# Altium schematic sheet 50_Audio_Codec.SchDoc: Audio
size A4; DrawnBy: Mateo Cárdenas; Revision: Rev A; SheetNumber: 6; SheetTotal: 7
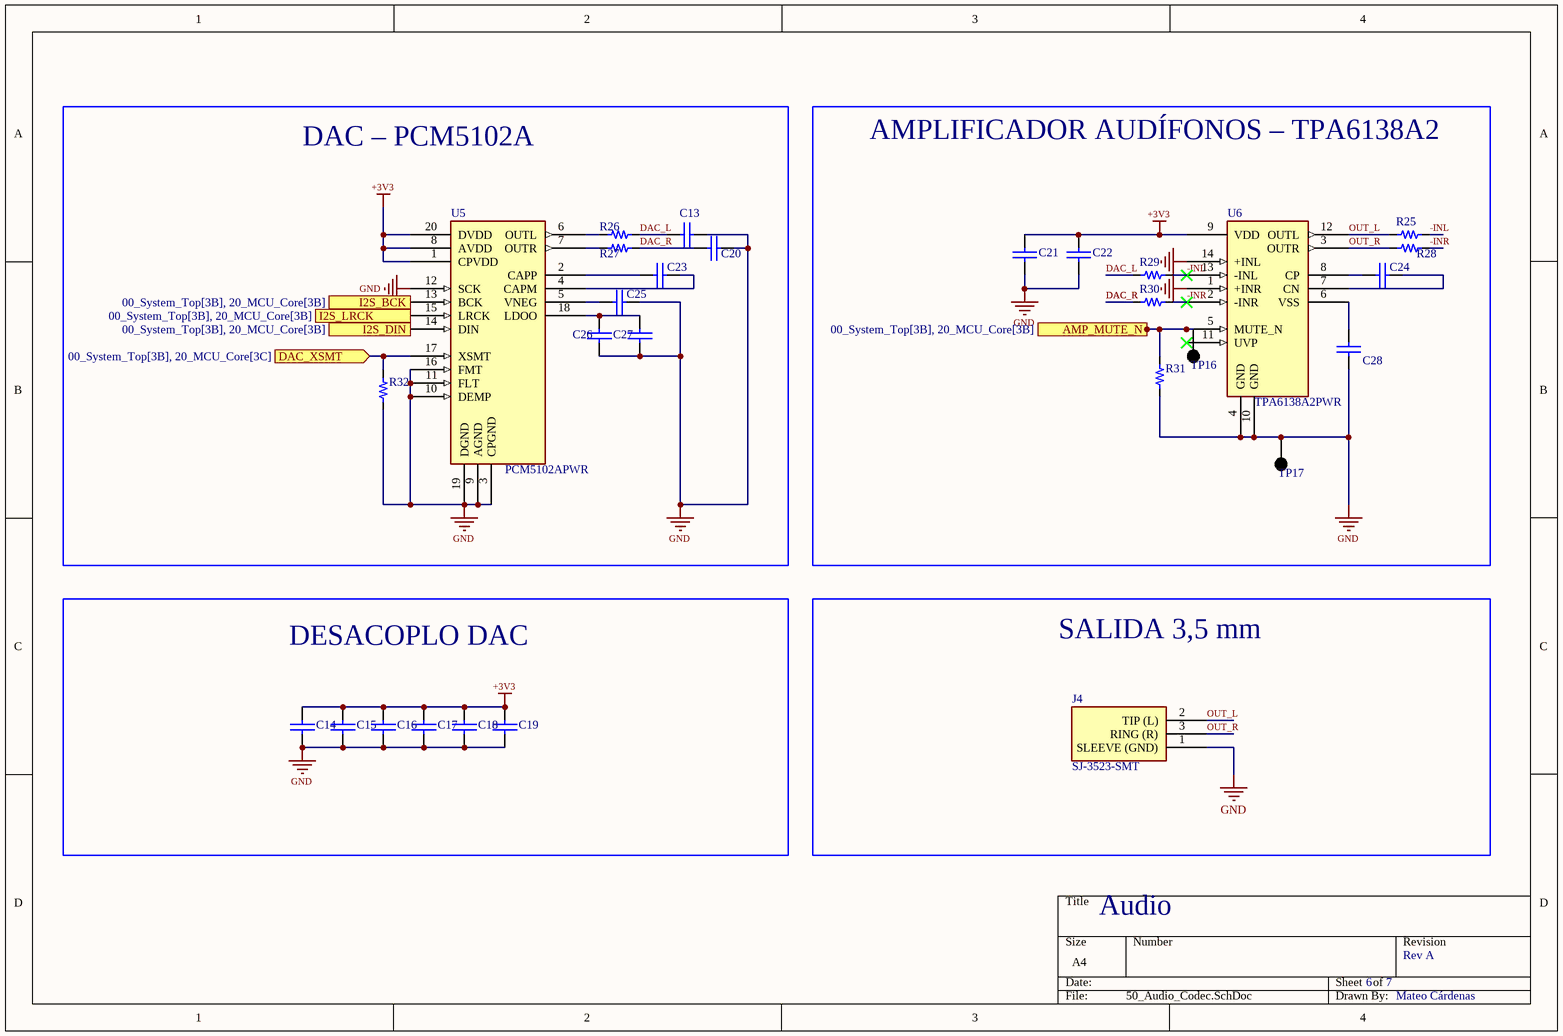
[diagram p0: 50_Audio_Codec.SchDoc]

## Parts
C13  2.2nF  [0603_cap]  (value not drawn)
C14  0.1uF 50V  [0603_cap]  (value not drawn)
C15  10uF 10V  [0603_cap]  (value not drawn)
C16  0.1uF 50V  [0603_cap]  (value not drawn)
C17  10uF 10V  [0603_cap]  (value not drawn)
C18  0.1uF 50V  [0603_cap]  (value not drawn)
C19  10uF 10V  [0603_cap]  (value not drawn)
C20  2.2nF  [0603_cap]  (value not drawn)
C21  0.1uF 50V  [0603_cap]  (value not drawn)
C22  1uF 50V  [0603_cap]  (value not drawn)
C23  2.2uF  [0603_cap]  (value not drawn)
C24  1uF 50V  [0603_cap]  (value not drawn)
C25  2.2uF  [0603_cap]  (value not drawn)
C26  10uF 10V  [0603_cap]  (value not drawn)
C27  0.1uF 50V  [0603_cap]  (value not drawn)
C28  1uF 50V  [0603_cap]  (value not drawn)
J4  SJ-3523-SMT  [Jack_3.5mm_SameSky_SJ-3523-SMT]
R25  10k 1/10W  [0603_res]  (value not drawn)
R26  470R  [0603_res]  (value not drawn)
R27  470R  [0603_res]  (value not drawn)
R28  10k 1/10W  [0603_res]  (value not drawn)
R29  10k 1/10W  [0603_res]  (value not drawn)
R30  10k 1/10W  [0603_res]  (value not drawn)
R31  100k  [0603_res]  (value not drawn)
R32  10k 1/10W  [0603_res]  (value not drawn)
TP16  Test Point  [Test Point]  (value not drawn)
TP17  Test Point  [Test Point]  (value not drawn)
U5  PCM5102APWR  [TSSOP-20_4.4x6.5mm_P0.65mm]
U6  TPA6138A2PWR  [TSSOP-14_4.4x5mm_P0.65mm]

## Blocks framed on the sheet
DAC – PCM5102A: C13 C20 C23 C25-C27 R26 R27 R32 U5
AMPLIFICADOR AUDÍFONOS – TPA6138A2: C21 C22 C24 C28 R25 R28-R31 TP16 TP17 U6
DESACOPLO DAC: C14-C19
SALIDA 3,5 mm: J4

## Ports
AMP_MUTE_N (in, see 00_System_Top[3B], 20_MCU_Core[3B]), DAC_XSMT (in, see 00_System_Top[3B], 20_MCU_Core[3C]), I2S_BCK (in, see 00_System_Top[3B], 20_MCU_Core[3B]), I2S_DIN (in, see 00_System_Top[3B], 20_MCU_Core[3B]), I2S_LRCK (in, see 00_System_Top[3B], 20_MCU_Core[3B])

## Nets
+3V3: C14.1 C15.1 C16.1 C17.1 C18.1 C19.1 C21.1 C22.1 U5.1(CPVDD) U5.8(AVDD) U5.20(DVDD) U6.9(VDD)
GND: C13.2 C14.2 C15.2 C16.2 C17.2 C18.2 C19.2 C20.2 C21.2 C22.2 C25.2 C26.2 C27.2 C28.1 J4.1(SLEEVE_(GND)) R31.1 R32.1 TP17.1(TP?) U5.3(CPGND) U5.9(AGND) U5.10(DEMP) U5.11(FLT) U5.12(SCK) U5.16(FMT) U5.19(DGND) U6.1(+INR) U6.4(GND) U6.10(GND) U6.14(+INL)
-INL: R25.2 R29.2 U6.13(-INL)
-INR: R28.2 R30.2 U6.2(-INR)
AMP_MUTE_N: R31.2 TP16.1(TP?) U6.5(MUTE_N) ; port AMP_MUTE_N
DAC_L: C13.1 R26.2 R29.1
DAC_R: C20.1 R27.2 R30.1
DAC_XSMT: R32.2 U5.17(XSMT) ; port DAC_XSMT
I2S_BCK: U5.13(BCK) ; port I2S_BCK
I2S_DIN: U5.14(DIN) ; port I2S_DIN
I2S_LRCK: U5.15(LRCK) ; port I2S_LRCK
OUT_L: J4.2(TIP_(L)) R25.1 U6.12(OUTL)
OUT_R: J4.3(RING_(R)) R28.1 U6.3(OUTR)
NetC23_1: C23.1 U5.2(CAPP)
NetC23_2: C23.2 U5.4(CAPM)
NetC24_1: C24.1 U6.8(CP)
NetC24_2: C24.2 U6.7(CN)
NetC25_1: C25.1 U5.5(VNEG)
NetC26_1: C26.1 C27.1 U5.18(LDOO)
NetC28_2: C28.2 U6.6(VSS)
NetR26_1: R26.1 U5.6(OUTL)
NetR27_1: R27.1 U5.7(OUTR)

Not connected (* = marked no-connect by the designer): U6 11(UVP)*

## Library data of the parts
C13 C20 = Cap_2.2nF_0603_50V: CAP CER 2.2 nF 50V X7R 0603; Manufacturer: TBD; Manufacturer Part Number: TBD; Supplier 1: TBD; Supplier Part Number 1: TBD; ComponentLink1Description: TBD; ComponentLink1URL: TBD; Value: 2.2nF
C14 C16 C18 C21 C27 = Cap_0.1uF_0603_50V: 50V 100nF Y5V -20%~+80% 0603 Multilayer Ceramic Capacitors MLCC - SMD/SMT ROHS; Manufacturer: Walsin Tech Corp; Manufacturer Part Number: 0603F104Z500CT; Supplier 1: LCSC; Supplier Part Number 1: C83060; ComponentLink1Description: LCSC; ComponentLink1URL: https://www.lcsc.com/product-detail/Multilayer-Ceramic-Capacitors-MLCC-SMD-SMT_Walsin-Tech-Corp-0603F104Z500CT_C83060.html; Value: 0.1uF
C15 C17 C19 C26 = Cap_10uF_0603_10V: 10V 10uF X5R ±10% 0603 Multilayer Ceramic Capacitors MLCC - SMD/SMT ROHS; Manufacturer: CCTC; Manufacturer Part Number: TCC0603X5R106K100CT; Supplier 1: LCSC; Supplier Part Number 1: C380314; ComponentLink1Description: LCSC; ComponentLink1URL: https://www.lcsc.com/product-detail/Multilayer-Ceramic-Capacitors-MLCC-SMD-SMT_CCTC-TCC0603X5R106K100CT_C380314.html; Value: 10uF
C22 C24 C28 = Cap_1uF_0603_50V: 50V 1uF X5R ±10% 0603 Multilayer Ceramic Capacitors MLCC - SMD/SMT ROHS; Manufacturer: Samsung Electro-Mechanics; Manufacturer Part Number: CL10A105KB8NNNC; Supplier 1: LCSC; Supplier Part Number 1: C15849; ComponentLink1Description: LCSC; ComponentLink1URL: https://www.lcsc.com/product-detail/Multilayer-Ceramic-Capacitors-MLCC-SMD-SMT_Samsung-Electro-Mechanics-CL10A105KB8NNNC_C15849.html; Value: 1uF
C23 C25 = Cap_2.2uF_0603_10V: CAP CER 2.2 µF 10V X5R 0603; Manufacturer: TBD; Manufacturer Part Number: TBD; Supplier 1: TBD; Supplier Part Number 1: TBD; ComponentLink1Description: TBD; ComponentLink1URL: TBD; Value: 2.2uF
J4 = SJ-3523-SMT: Same Sky 3.5 mm stereo jack, SMT, no switch. 1 = sleeve, 2 = tip, 3 = ring.; Manufacturer: Same Sky (CUI Devices); Manufacturer Part Number: SJ-3523-SMT-TR; Verification: Pinout and land pattern from datasheet; not yet built or tested; Datasheet: sj-352x-smt.pdf dated 04/15/2025
R25 R28-R30 R32 = Res_10k_0603_1/10W: RES SMD 10k OHM 5% 1/10W 0603; Manufacturer: FOJAN; Manufacturer Part Number: FRC0603J103TS; ComponentLink1URL: https://www.lcsc.com/product-detail/Chip-Resistor-Surface-Mount_FOJAN-FRC0603J103TS_C2930027.html; Supplier 1: LCSC; Supplier Part Number 1: C2930027; ComponentLink1Description: LCSC; Value: 10k
R26 R27 = Res_470R_0603_1/10W: RES 470 Ω 1% 1/10W 0603; Manufacturer: TBD; ComponentLink1URL: TBD; Manufacturer Part Number: TBD; Supplier 1: TBD; Supplier Part Number 1: TBD; ComponentLink1Description: TBD; Value: 470R
R31 = Res_100k_0603_1/10W: RES 100 kΩ 1% 1/10W 0603; Manufacturer: TBD; ComponentLink1URL: TBD; Manufacturer Part Number: TBD; Supplier 1: TBD; Supplier Part Number 1: TBD; ComponentLink1Description: TBD; Value: 100k
TP16 TP17 = Test Point: PC TEST POINT; Manufacturer: KOA Speer Electronics, Inc.; Manufacturer Part Number: RCWCTE
U5 = PCM5102APWR: TI PCM5102A 32-bit 384 kHz I2S stereo DAC, 2.1 Vrms ground-centred line output, TSSOP-20. Hardware control only (no I2C).; Manufacturer: Texas Instruments; Verification: Pinout and land pattern from datasheet; not yet built or tested; Manufacturer Part Number: PCM5102APWR; Datasheet: SLAS859C (May 2015)
U6 = TPA6138A2PWR: TI TPA6138A2 25 mW DirectPath ground-centred stereo headphone amp with adjustable gain, TSSOP-14. No output coupling capacitors needed.; Manufacturer: Texas Instruments; Verification: Pinout and land pattern from datasheet; not yet built or tested; Manufacturer Part Number: TPA6138A2PWR; Datasheet: SLOS704B (Aug 2015)